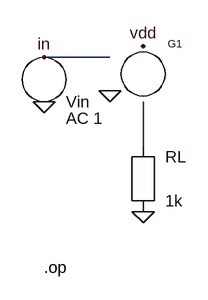
[diagram p0: schematic vccs_stage_drawn.asc]
vccs_stage_drawn.asc, the LTspice schematic file:
Version 4
SHEET 1 880 680
WIRE 176 192 272 192
WIRE 320 256 320 320
FLAG 176 192 in
FLAG 320 176 vdd
FLAG 176 256 0
FLAG 272 240 0
FLAG 320 416 0
SYMBOL g 320 160 R0
SYMATTR InstName G1
SYMATTR Value 1m
SYMBOL voltage 176 224 R0
SYMATTR InstName Vin
SYMATTR Value AC 1
SYMBOL res 320 368 R0
SYMATTR InstName RL
SYMATTR Value 1k
TEXT 176 496 Left 2 !.op

The netlist it stands for:
* vccs_stage_drawn.asc
G1 N001 vdd in 0 1m
Vin in 0 AC 1
RL N001 0 1k
.op
.backanno
.end